# Altium project Digit_output.PrjPcb
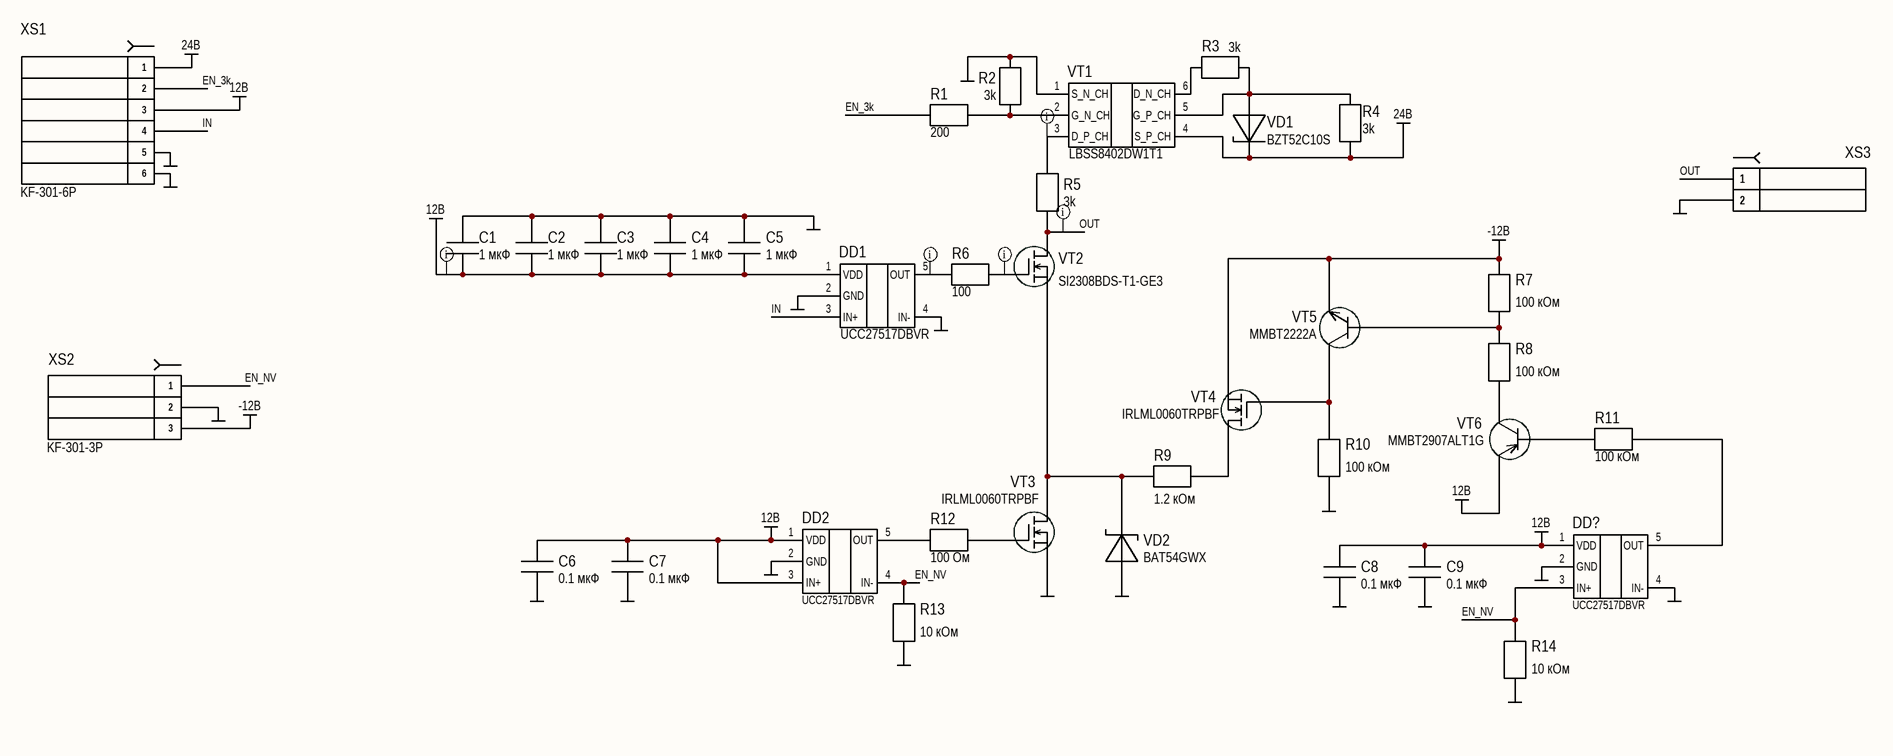
[diagram p0: Digit_output.SchDoc]
4 sheets, 37 parts. Net scope: global (net labels, ports and power ports of the same name join across sheets).
Board file: Шаблон проекта.PcbDoc
Sheets:
  Digit_output.SchDoc
  Шаблон проекта Л2.SchDoc
  Шаблон проекта Л3.SchDoc
  Шаблон проекта Л4.SchDoc

## Sheet Digit_output.SchDoc
size 420 x 297 mm; Разраб.: Разраб.; Пров.: Пров.; Т.контр.: Т. контр.; Н.контр.: Н. контр; Утв.: Утв.; Лист: 1; Листов: 4; Децим.  №: ХXX.XXXXX.XXX.Э3; Название: Название; Лист.: 1; Листов.: 1

### Parts
C1  1 мкФ  [CAP 0603 3D]
C2  1 мкФ  [CAP 0603 3D]
C3  1 мкФ  [CAP 0603 3D]
C4  1 мкФ  [CAP 0603 3D]
C5  1 мкФ  [CAP 0603 3D]
C6  0.1 мкФ  [CAP 0603 3D]
C7  0.1 мкФ  [CAP 0603 3D]
C8  0.1 мкФ  [CAP 0603 3D]
C9  0.1 мкФ  [CAP 0603 3D]
DD1  UCC27517DBVR  [SOT-23-5]
DD2  UCC27517DBVR  [SOT-23-5]
DD?  UCC27517DBVR  [SOT-23-5]
R1  200  [Res_0603 3D]
R2  3k  [Res_0603 3D]
R3  3k  [Res_0603 3D]
R4  3k  [Res_0603 3D]
R5  3k  [Res_2512 3D]
R6  100  [Res_0603 3D]
R7  100 кОм  [Res_0603 3D]
R8  100 кОм  [Res_0603 3D]
R9  1.2 кОм  [Res_2512 3D]
R10  100 кОм  [Res_0603 3D]
R11  100 кОм  [Res_0603 3D]
R12  100 Ом  [Res_0603 3D]
R13  10 кОм  [Res_0603 3D]
R14  10 кОм  [Res_0603 3D]
VD1  BZT52C10S  [SOD-323]
VD2  BAT54GWX  [SOD-123f]
VT1  LBSS8402DW1T1  [SOT-363]
VT2  SI2308BDS-T1-GE3  [SOT-23-3]
VT3  IRLML0060TRPBF  [SOT-23-3]
VT4  IRLML0060TRPBF  [SOT-23-3]
VT5  MMBT2222A  [SOT-23-3]
VT6  MMBT2907ALT1G  [SOT-23-3]
XS1  KF-301-6P  [Degson_DG301-5.0-06P-1X]
XS2  KF-301-3P  [Degson_DG301-5.0-03P-1X]
XS3  KF-301-2P  [Degson_DG301-5.0-02P-1X]  (value not drawn)

### Nets
12В: C1.2 C2.2 C3.2 C4.2 C5.2 C6.1 C7.1 C8.1 C9.1 DD1.1(VDD) DD2.1(VDD) DD2.3(IN+) DD?.1(VDD) VT6.3(E) XS1.3
24В: R4.1 VD1.1(K) VT1.4(S_P_CH) XS1.1
-12В: R7.2 VT4.3(S) VT5.3(E) XS2.3
GND: C1.1 C2.1 C3.1 C4.1 C5.1 C6.2 C7.2 C8.2 C9.2 DD1.2(GND) DD1.4(IN-) DD2.2(GND) DD?.2(GND) DD?.4(IN-) R2.2 R10.1 R13.1 R14.1 VD2.2(A) VT1.1(S_N_CH) VT3.3(S) XS1.5 XS1.6 XS2.2 XS3.2
EN_3k: R1.1 XS1.2
EN_NV: DD2.4(IN-) DD?.3(IN+) R13.2 R14.2 XS2.1
IN: DD1.3(IN+) XS1.4
OUT: R5.1 VT2.2(D) XS3.1
NetDD1_5: DD1.5(OUT) R6.1
NetDD2_5: DD2.5(OUT) R12.1
NetDD?_5: DD?.5(OUT) R11.2
NetR1_2: R1.2 R2.1 VT1.2(G_N_CH)
NetR3_1: R3.1 VT1.6(D_N_CH)
NetR3_2: R3.2 R4.2 VD1.2(A) VT1.5(G_P_CH)
NetR5_2: R5.2 VT1.3(D_P_CH)
NetR6_2: R6.2 VT2.1(G)
NetR7_1: R7.1 R8.2 VT5.1(B)
NetR8_1: R8.1 VT6.2(C)
NetR9_1: R9.1 VD2.1(K) VT2.3(S) VT3.2(D)
NetR9_2: R9.2 VT4.2(D)
NetR10_2: R10.2 VT4.1(G) VT5.2(C)
NetR11_1: R11.1 VT6.1(B)
NetR12_2: R12.2 VT3.1(G)

### Layout directives
net class Power: 12В, NetDD1_5, NetR5_2, NetR6_2, OUT

### Notes on the sheet
- Перв. примен.
- Справ. №
- Подп. и дата
- Инв. № дубл.
- Взам. инв. №
- Изм.
- Лист
- № докум
- Подпись
- Дата
- Лит.
- Масса
- Масштаб
- Разраб
- Пров
- Т.контр.
- Листов
- Инв.№ подл.
- Н.контр.
- Утв.

### Library data of the parts
C1-C5 = C: GCM188R71E105KA64D
C6-C9 = C: GRM188R71H104KA93D
DD1 DD2 DD? = UCC27517
R1 = R: RC0603FR-07200RL
R2-R4 = R: RC0603FR-073KL
R5 = R: RC2512FR-073KL
R6 R12 = R: RC0603FR-07100RL
R7 R8 R10 R11 = R: RC0603FR-07100KL
R9 = R: RC2512FR-071K2L
R13 R14 = R: RC0603FR-0710KL
VD1 = Стаб. х1 K-A
VD2 = Диод Шот. х1
VT1 = LBSS8402DW1T1G: LBSS8402DW1T1G/BSS8402DW-7-F
VT2-VT4 = VT MOSFET-N
VT5 = VT NPN
VT6 = VT PNP

## Sheet Шаблон проекта Л2.SchDoc
size 420 x 297 mm; Разраб.: Разраб.; Лист: 2; Листов: 4; Децим.  №: XXX.XXXXX.XXX.Э3

### Notes on the sheet
- Перв. примен.
- Справ. №
- Подп. и дата
- Инв. № дубл.
- Взам. инв. №
- Инв.№ подл.
- Лист
- Изм.
- № докум
- Подпись
- Дата

## Sheet Шаблон проекта Л3.SchDoc
size 420 x 297 mm; Разраб.: Разраб.; Лист: 3; Листов: 4; Децим.  №: XXX.XXXXX.XXX.Э3

### Notes on the sheet
- Перв. примен.
- Справ. №
- Подп. и дата
- Инв. № дубл.
- Взам. инв. №
- Инв.№ подл.
- Лист
- Изм.
- № докум
- Подпись
- Дата

## Sheet Шаблон проекта Л4.SchDoc
size 420 x 297 mm; Разраб.: Бурыкин; Лист: 4; Листов: 4; Децим.  №: XXX.XXXXX.XXX.Э3

### Notes on the sheet
- Перв. примен.
- Справ. №
- Подп. и дата
- Инв. № дубл.
- Взам. инв. №
- Инв.№ подл.
- Лист
- Изм.
- № докум
- Подпись
- Дата